# EAGLE design ce_hdd_acsi (EAGLE 6.2)
Assembly variants: ACSI, SCSI

## Sheet 1 of 3: IKBD part
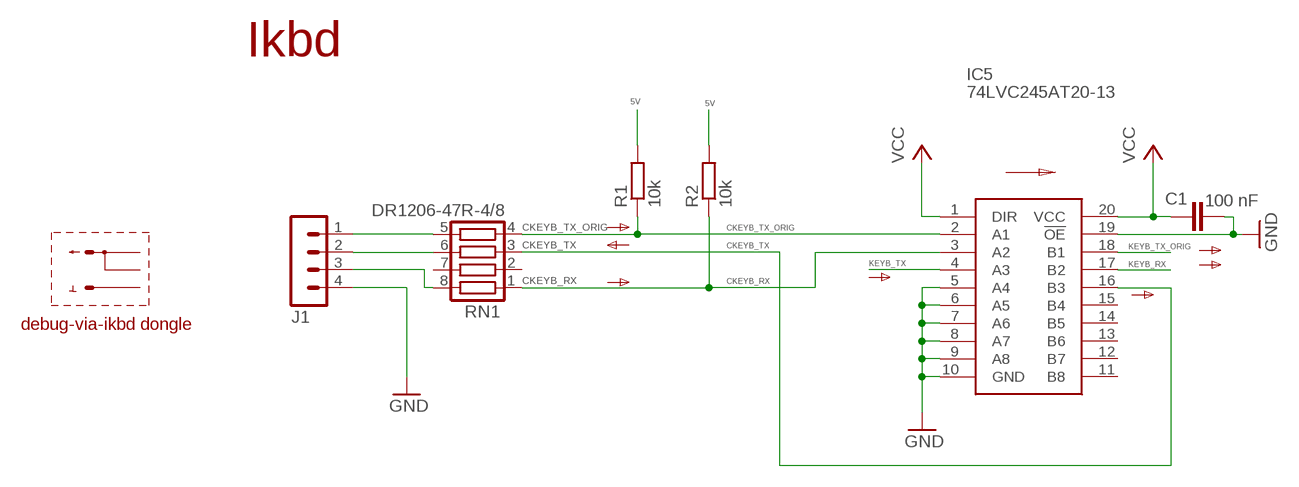
[diagram p0: schematic, sheet 1]

### Parts
C1  100 nF  C-EUC0603  [C0603]
IC5  74LVC245AT20-13  [SOP65P640X120-20N]
J1  MA04-1  [MA04-1]
R1  10k  R-EU_R0603  [R0603]
R2  10k  R-EU_R0603  [R0603]
RN1  DR1206-47R-4/8  CTS742C083  [CTS742C083]

### Nets
5V: R1.2 R2.2 ; also sheet 3
CKEYB_RX: IC5.3(A2) R2.1 RN1.1
CKEYB_TX: IC5.16(B3) RN1.3
CKEYB_TX_ORIG: IC5.2(A1) R1.1 RN1.4
GND: C1.1 IC5.5(A4) IC5.6(A5) IC5.7(A6) IC5.8(A7) IC5.9(A8) IC5.10(GND) IC5.19(!OE) J1.4 ; also sheet 2,3
KEYB_RX: IC5.17(B2) ; also sheet 3
KEYB_TX: IC5.4(A3) ; also sheet 3
KEYB_TX_ORIG: IC5.18(B1) ; also sheet 3
N$21: J1.2 RN1.6
VCC: C1.2 IC5.1(DIR) IC5.20(VCC) ; also sheet 2,3
ZKEYB_RX: J1.3 RN1.8
ZKEYB_TX_ORIG: J1.1 RN1.5
Unconnected: IC5.11(B8) IC5.12(B7) IC5.13(B6) IC5.14(B5) IC5.15(B4) RN1.2 RN1.7

### Notes on the sheet
- Ikbd
- debug-via-ikbd dongle

## Sheet 2 of 3: ACSI driver and connector
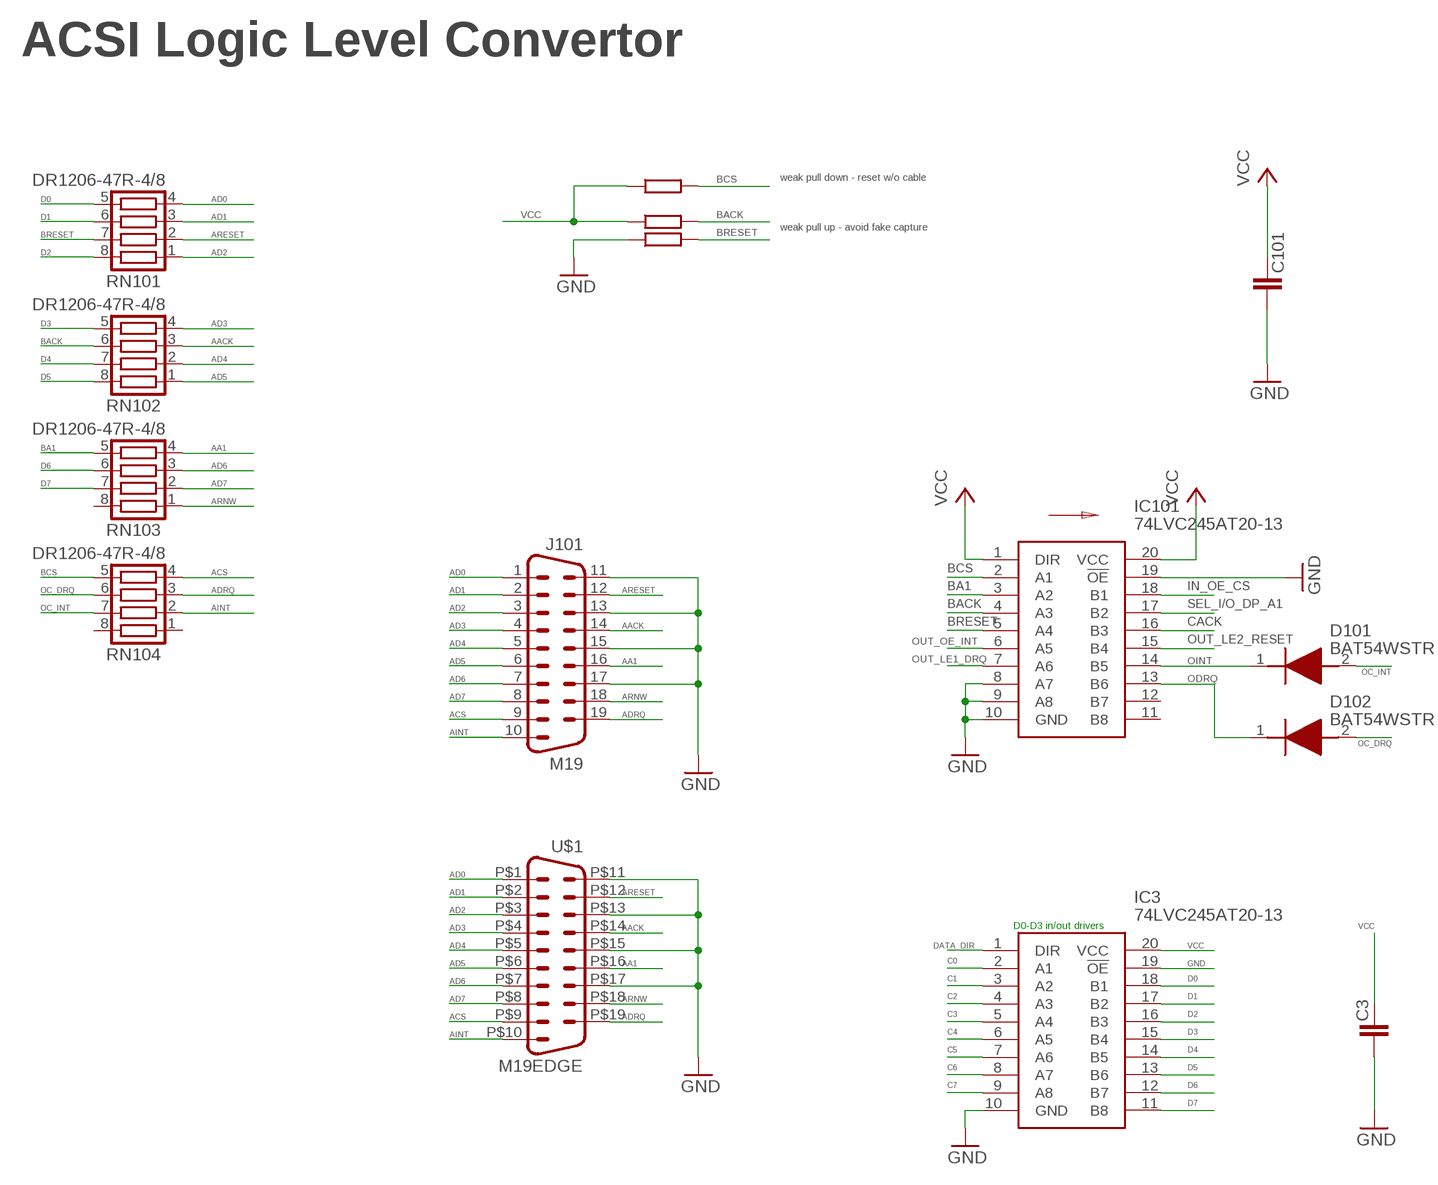
[diagram p1: schematic, sheet 2]

### Parts
C3  100 nF  C-EUC0603  [C0603]
C101  1 uF  C-EUC0603  [C0603]  (not fitted in variant SCSI)
D101  BAT54WSTR  [SOD2613X100N]  (not fitted in variant SCSI)
D102  BAT54WSTR  [SOD2613X100N]  (not fitted in variant SCSI)
IC3  74LVC245AT20-13  [SOP65P640X120-20N]
IC101  74LVC245AT20-13  [SOP65P640X120-20N]  (not fitted in variant SCSI)
J101  M19  [M19]  (not fitted in variant SCSI)
R102  10k  R-EU_R0603  [R0603]  (not fitted in variant SCSI)
R103  10k  R-EU_R0603  [R0603]  (not fitted in variant SCSI)
R104  10k  R-EU_R0603  [R0603]  (not fitted in variant SCSI)
RN101  DR1206-47R-4/8  CTS742C083  [CTS742C083]  (not fitted in variant SCSI)
RN102  DR1206-47R-4/8  CTS742C083  [CTS742C083]  (not fitted in variant SCSI)
RN103  DR1206-47R-4/8  CTS742C083  [CTS742C083]  (not fitted in variant SCSI)
RN104  DR1206-47R-4/8  CTS742C083  [CTS742C083]  (not fitted in variant SCSI)
U$1  M19EDGE  [M19_EDGE]

### Nets
AA1: J101.16 RN103.4 U$1.P$16
AACK: J101.14 RN102.3 U$1.P$14
ACS: J101.9 RN104.4 U$1.P$9
AD0: J101.1 RN101.4 U$1.P$1
AD1: J101.2 RN101.3 U$1.P$2
AD2: J101.3 RN101.1 U$1.P$3
AD3: J101.4 RN102.4 U$1.P$4
AD4: J101.5 RN102.2 U$1.P$5
AD5: J101.6 RN102.1 U$1.P$6
AD6: J101.7 RN103.3 U$1.P$7
AD7: J101.8 RN103.2 U$1.P$8
ADRQ: J101.19 RN104.3 U$1.P$19
AINT: J101.10 RN104.2 U$1.P$10
ARESET: J101.12 RN101.2 U$1.P$12
ARNW: J101.18 RN103.1 U$1.P$18
BA1: IC101.3(A2) RN103.5
BACK: IC101.4(A3) R103.2 RN102.6
BCS: IC101.2(A1) R102.2 RN104.5
BRESET: IC101.5(A4) R104.2 RN101.7
C0: IC3.2(A1) ; also sheet 3
C1: IC3.3(A2) ; also sheet 3
C2: IC3.4(A3) ; also sheet 3
C3: IC3.5(A4) ; also sheet 3
C4: IC3.6(A5) ; also sheet 3
C5: IC3.7(A6) ; also sheet 3
C6: IC3.8(A7) ; also sheet 3
C7: IC3.9(A8) ; also sheet 3
CACK: IC101.16(B3) ; also sheet 3
D0: IC3.18(B1) RN101.5
D1: IC3.17(B2) RN101.6
D2: IC3.16(B3) RN101.8
D3: IC3.15(B4) RN102.5
D4: IC3.14(B5) RN102.7
D5: IC3.13(B6) RN102.8
D6: IC3.12(B7) RN103.6
D7: IC3.11(B8) RN103.7
DATA_DIR: IC3.1(DIR) ; also sheet 3
GND: C3.2 C101.2 IC3.10(GND) IC3.19(!OE) IC101.8(A7) IC101.9(A8) IC101.10(GND) IC101.19(!OE) J101.11 J101.13 J101.15 J101.17 R104.1 U$1.P$11 U$1.P$13 U$1.P$15 U$1.P$17 ; also sheet 1,3
IN_OE_CS: IC101.18(B1) ; also sheet 3
OC_DRQ: D102.2(A) RN104.6
OC_INT: D101.2(A) RN104.7
ODRQ: D102.1(K) IC101.13(B6)
OINT: D101.1(K) IC101.14(B5)
OUT_LE1_DRQ: IC101.7(A6) ; also sheet 3
OUT_LE2_RESET: IC101.15(B4) ; also sheet 3
OUT_OE_INT: IC101.6(A5) ; also sheet 3
SEL_I/O_DP_A1: IC101.17(B2) ; also sheet 3
VCC: C3.1 C101.1 IC3.20(VCC) IC101.1(DIR) IC101.20(VCC) R102.1 R103.1 ; also sheet 1,3
Unconnected: IC101.11(B8) IC101.12(B7) RN103.8 RN104.1 RN104.8

### Notes on the sheet
- ACSI Logic Level Convertor
- weak pull down - reset w/o cable
- weak pull up - avoid fake capture
- D0-D3 in/out drivers

## Sheet 3 of 3: PICO, power, LEDs
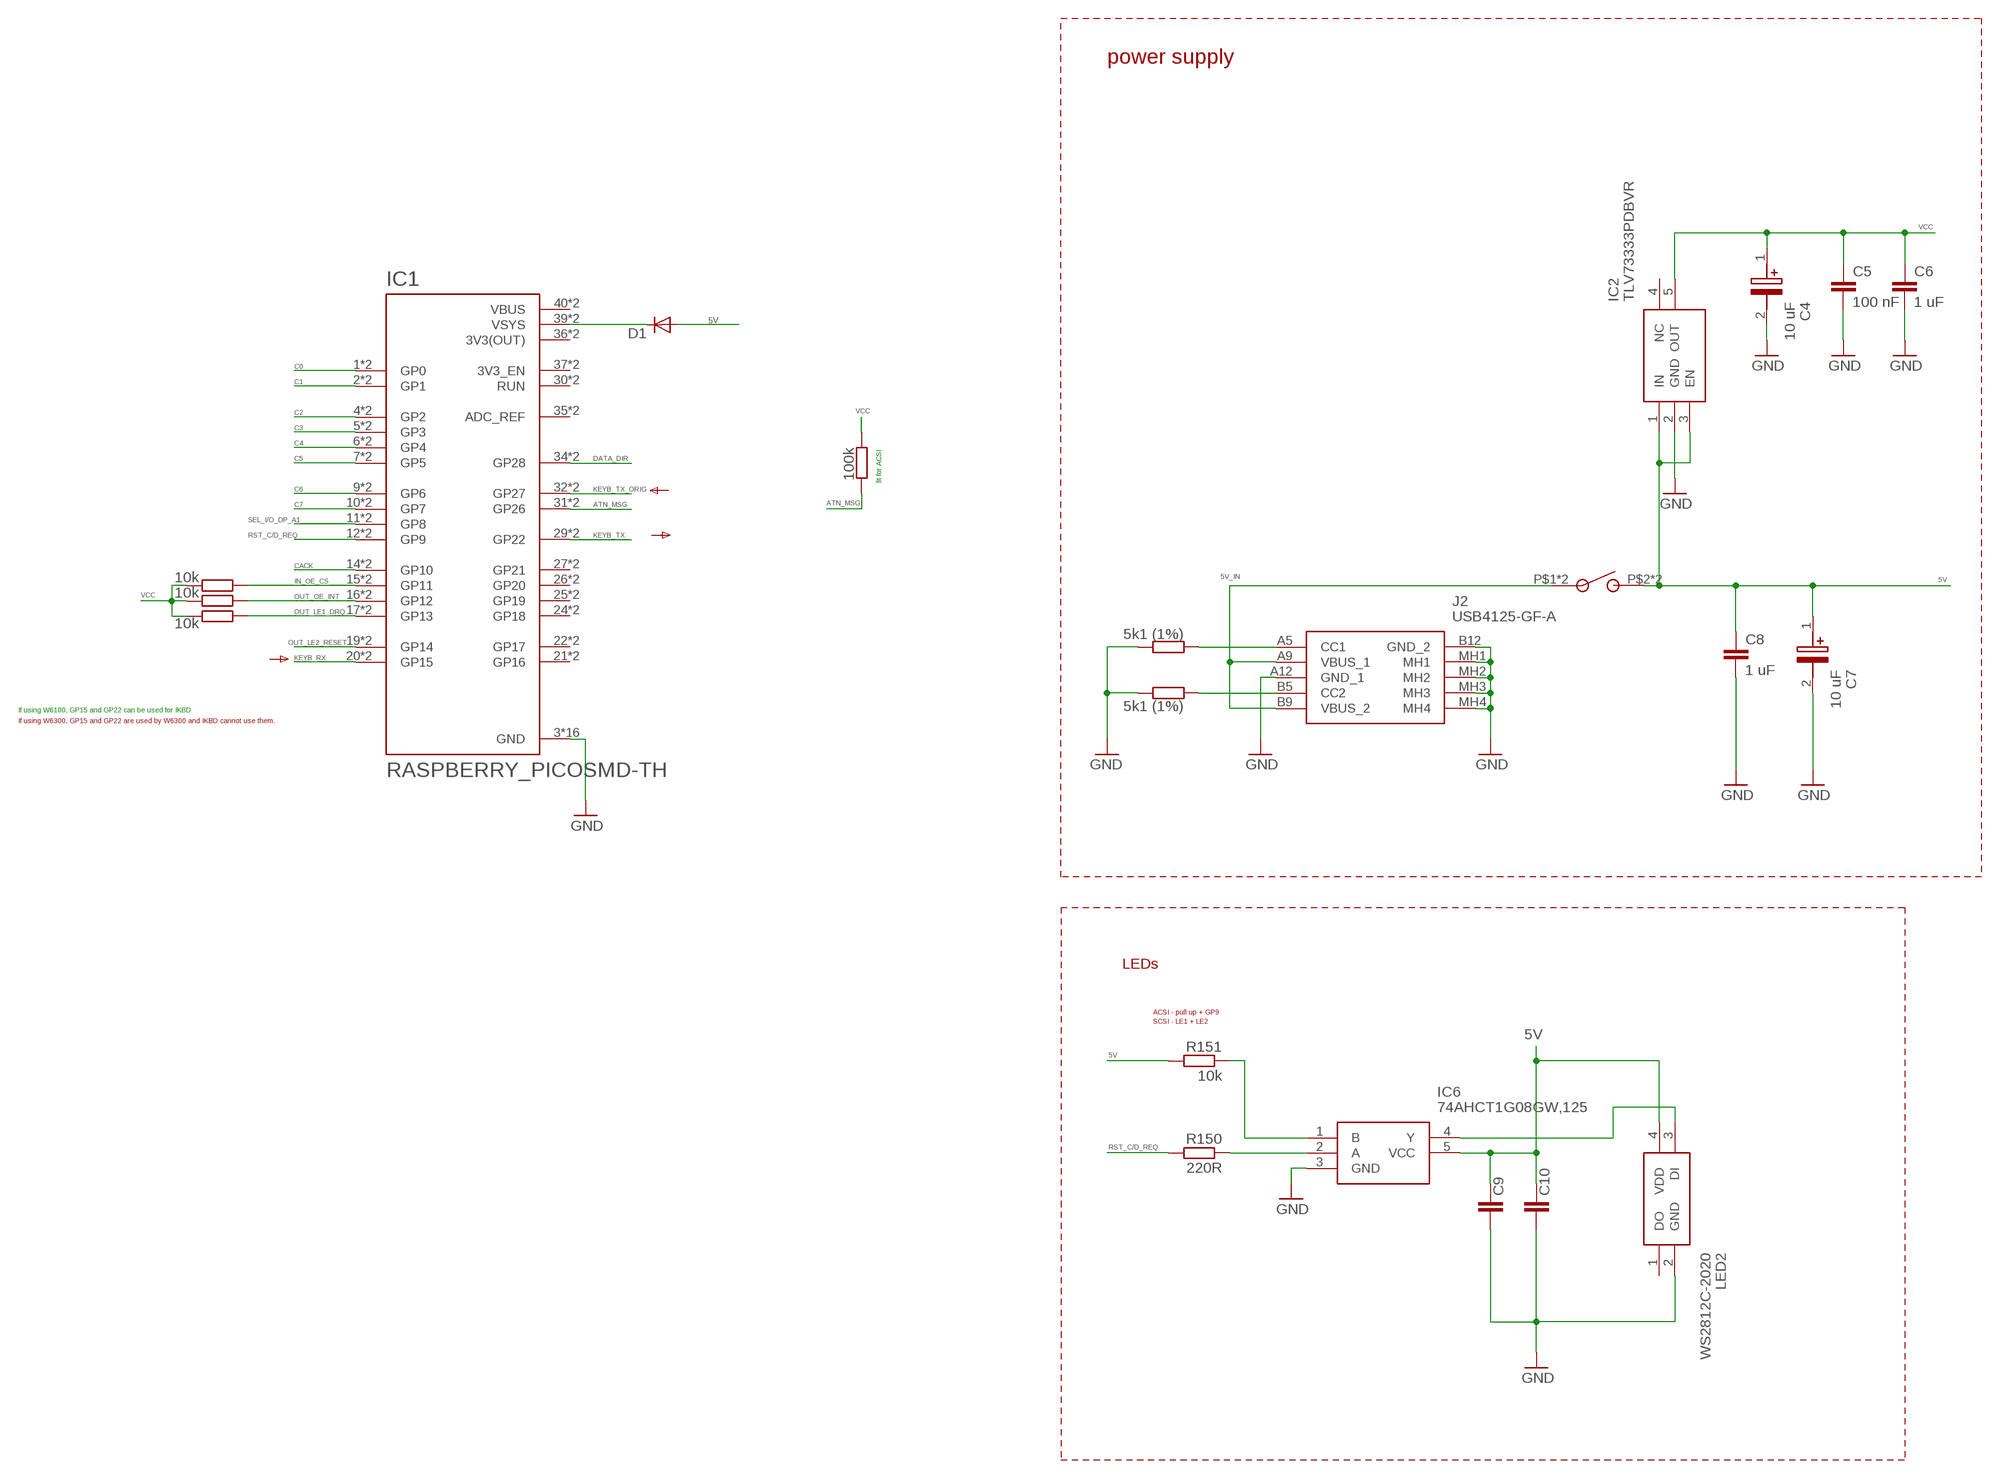
[diagram p2: schematic, sheet 3]

### Parts
C4  10 uF  293D106X9016B2TE3  [CAPPM3528X210N]
C5  100 nF  C-EUC0603  [C0603]
C6  1 uF  C-EUC0603  [C0603]
C7  10 uF  293D106X9016B2TE3  [CAPPM3528X210N]
C8  1 uF  C-EUC0603  [C0603]
C9  100 nF  C-EUC0603  [C0603]
C10  100 nF  C-EUC0603  [C0603]
D1  SK110-DIO  DIODE-DO214AC  [DO214AC]
IC1  RASPBERRY_PICOSMD-TH  [PICO-PKG]
IC2  TLV73333PDBVR  [SOT95P280X145-5N]
IC6  74AHCT1G08GW,125  [SOT65P212X110-5N]
J2  USB4125-GF-A  [USB4125GFA]
LED2  WS2812C-2020  [WS2812C2020]
R3  5k1 (1%)  R-EU_R0603  [R0603]
R4  5k1 (1%)  R-EU_R0603  [R0603]
R6  10k  R-EU_R0603  [R0603]
R7  10k  R-EU_R0603  [R0603]
R8  10k  R-EU_R0603  [R0603]
R125  100k  R-EU_R0603  [R0603]  (not fitted in variant SCSI)
R150  220R  R-EU_R0603  [R0603]  (not fitted in variant SCSI)
R151  10k  R-EU_R0603  [R0603]  (not fitted in variant SCSI)
SW1  SMSR-1  [SMRS-1]

### Nets
5V: C7.1(+) C8.1 C9.1 C10.1 D1.A IC2.1(IN) IC2.3(EN) IC6.5(VCC) LED2.4(VDD) R151.2 SW1.P$2 SW1.P$3 ; also sheet 1
5V_IN: J2.A9(VBUS_1) J2.B9(VBUS_2) SW1.P$1 SW1.P$4
ATN_MSG: IC1.31(GP26) IC1.P$31(GP26) R125.2
C0: IC1.1(GP0) IC1.P$1(GP0) ; also sheet 2
C1: IC1.2(GP1) IC1.P$2(GP1) ; also sheet 2
C2: IC1.4(GP2) IC1.P$4(GP2) ; also sheet 2
C3: IC1.5(GP3) IC1.P$5(GP3) ; also sheet 2
C4: IC1.6(GP4) IC1.P$6(GP4) ; also sheet 2
C5: IC1.7(GP5) IC1.P$7(GP5) ; also sheet 2
C6: IC1.9(GP6) IC1.P$9(GP6) ; also sheet 2
C7: IC1.10(GP7) IC1.P$10(GP7) ; also sheet 2
CACK: IC1.14(GP10) IC1.P$14(GP10) ; also sheet 2
DATA_DIR: IC1.34(GP28) IC1.P$34(GP28) ; also sheet 2
GND: C4.2(-) C5.2 C6.2 C7.2(-) C8.2 C9.2 C10.2 IC1.3(GND) IC1.8(GND) IC1.13(GND) IC1.18(GND) IC1.23(GND) IC1.28(GND) IC1.33(GND) IC1.38(GND) IC1.P$3(GND) IC1.P$8(GND) IC1.P$13(GND) IC1.P$18(GND) IC1.P$23(GND) IC1.P$28(GND) IC1.P$33(GND) IC1.P$38(GND) IC2.2(GND) IC6.3(GND) J2.A12(GND_1) J2.B12(GND_2) J2.MH1 J2.MH2 J2.MH3 J2.MH4 LED2.2(GND) R3.2 R4.2 ; also sheet 1,2
IN_OE_CS: IC1.15(GP11) IC1.P$15(GP11) R6.2 ; also sheet 2
KEYB_RX: IC1.20(GP15) IC1.P$20(GP15) ; also sheet 1
KEYB_TX: IC1.29(GP22) IC1.P$29(GP22) ; also sheet 1
KEYB_TX_ORIG: IC1.32(GP27) IC1.P$32(GP27) ; also sheet 1
N$1: J2.B5(CC2) R4.1
N$2: J2.A5(CC1) R3.1
N$3: IC6.2(A) R150.1
N$4: IC6.1(B) R151.1
N$7: IC6.4(Y) LED2.3(DI)
N$26: D1.C IC1.39(VSYS) IC1.P$39(VSYS)
OUT_LE1_DRQ: IC1.17(GP13) IC1.P$17(GP13) R8.2 ; also sheet 2
OUT_LE2_RESET: IC1.19(GP14) IC1.P$19(GP14) ; also sheet 2
OUT_OE_INT: IC1.16(GP12) IC1.P$16(GP12) R7.2 ; also sheet 2
RST_C/D_REQ: IC1.12(GP9) IC1.P$12(GP9) R150.2
SEL_I/O_DP_A1: IC1.11(GP8) IC1.P$11(GP8) ; also sheet 2
VCC: C4.1(+) C5.1 C6.1 IC2.5(OUT) R6.1 R7.1 R8.1 R125.1 ; also sheet 1,2
Unconnected: IC1.21(GP16) IC1.22(GP17) IC1.24(GP18) IC1.25(GP19) IC1.26(GP20) IC1.27(GP21) IC1.30(RUN) IC1.35(ADC_REF) IC1.37(3V3_EN) IC1.P$21(GP16) IC1.P$22(GP17) IC1.P$24(GP18) IC1.P$25(GP19) IC1.P$26(GP20) IC1.P$27(GP21) IC1.P$30(RUN) IC1.P$35(ADC_REF) IC1.P$37(3V3_EN) IC2.4(NC) LED2.1(DO)

### Notes on the sheet
- power supply
- fit for ACSI
- If using W6100, GP15 and GP22 can be used for IKBD
- If using W6300, GP15 and GP22 are used by W6300 and IKBD cannot use them.
- LEDs
- ACSI - pull up + GP9
- SCSI - LE1 + LE2

## Power pins joined to a net without a drawn wire
3V3(OUT): IC1.36(3V3(OUT)) IC1.P$36(3V3(OUT))
VBUS: IC1.40(VBUS) IC1.P$40(VBUS)

## Library data of the parts
C1 C3 C5 C6 C8-C10 C101 = rcl:C-EU: CAPACITOR, European symbol
C4 C7 = 293D106X9016B2TE3:293D106X9016B2TE3: Solid Tantalum Surface Mount Chip Capacitors TANTAMOUNT(TM), Molded Case, Standard Industrial Grade Source: Datasheet <http://www.vishay.com/docs/40002/293d.pdf>; DESCRIPTION: Solid Tantalum Surface Mount Chip Capacitors TANTAMOUNT(TM), Molded Case, Standard Industrial Grade; HEIGHT: 2.1mm; MANUFACTURER_NAME: Vishay; MANUFACTURER_PART_NUMBER: 293D106X9016B2TE3
D1 = diode:DIODE-: DIODE
D101 D102 = BAT54WSTR:BAT54WSTR: DIODE SCHOTTKY 30V 200MA SOD323 Source: Datasheet <http://www.smc-diodes.com/propdf/BAT54WS N0714 REV.D.pdf>; DESCRIPTION: DIODE SCHOTTKY 30V 200MA SOD323; HEIGHT: 1mm; MANUFACTURER_NAME: SMC Diode Solutions; MANUFACTURER_PART_NUMBER: BAT54WSTR
IC1 = RpiPico:RASPBERRY_PICO: Raspberry Pi Pico
IC2 = TLV73333PDBVR:TLV73333PDBVR: Capacitor-free 300-mA low-dropout (LDO) regulator with foldback current limit for portable devices Source: Datasheet <http://www.ti.com/lit/gpn/tlv733p>; DESCRIPTION: Capacitor-free 300-mA low-dropout (LDO) regulator with foldback current limit for portable devices; HEIGHT: 1.45mm; MANUFACTURER_NAME: Texas Instruments; MANUFACTURER_PART_NUMBER: TLV73333PDBVR
IC3 IC5 IC101 = 74LVC245AT20-13:74LVC245AT20-13: Bus Transceivers Octal Buffer Trans 3-State Outputs Source: Datasheet <https://www.diodes.com/assets/Datasheets/74LVC245A.pdf>; DESCRIPTION: Bus Transceivers Octal Buffer Trans 3-State Outputs; HEIGHT: 1.2mm; MANUFACTURER_NAME: Diodes Incorporated; MANUFACTURER_PART_NUMBER: 74LVC245AT20-13
IC6 = 74AHCT1G08GW_125:74AHCT1G08GW,125: 74AHC(T)1G08 - 2-input AND gate@en-us Source: Datasheet <https://assets.nexperia.com/documents/data-sheet/74AHC_AHCT1G08.pdf>; DESCRIPTION: 74AHC(T)1G08 - 2-input AND gate@en-us; HEIGHT: 1.1mm; MANUFACTURER_NAME: Nexperia; MANUFACTURER_PART_NUMBER: 74AHCT1G08GW,125
J1 = con-lstb:MA04-1: PIN HEADER; OC_FARNELL: unknown; OC_NEWARK: unknown
J2 = USB4125-GF-A:USB4125-GF-A: USB-C (USB TYPE-C) Receptacle Connector 24 (6+18 Dummy) Position Surface Mount, Right Angle; Through Hole Source: Datasheet <https://gct.co/files/drawings/usb4125.pdf?v=f2858e04-a173-4b74-b17f-8f865ddc3728>; DESCRIPTION: USB-C (USB TYPE-C) Receptacle Connector 24 (6+18 Dummy) Position Surface Mount, Right Angle; Through Hole; HEIGHT: 3.41mm; MANUFACTURER_NAME: GCT (GLOBAL CONNECTOR TECHNOLOGY); MANUFACTURER_PART_NUMBER: USB4125-GF-A
J101 U$1 = con_subd19:M19
LED2 = WS2812C-2020:WS2812C-2020: Intelligent control LED integrated light source Source: Datasheet <http://www.world-semi.com/DownLoadFile/139>; DESCRIPTION: Intelligent control LED integrated light source; HEIGHT: 0.84mm; MANUFACTURER_NAME: Worldsemi; MANUFACTURER_PART_NUMBER: WS2812C-2020
R1-R4 R6-R8 R102-R104 R125 R150 R151 = rcl:R-EU_: RESISTOR, European symbol
RN1 RN101-RN104 = resistor-net:CTS742C083: Chip Resistor Array 4 Single Resistor Source: http://www.ctscorp.com/components/Datasheets/CTSChipArrayDs.pdf; OC_FARNELL: unknown; OC_NEWARK: unknown
SW1 = ce_fdd_v40:SMSR-1

## Board
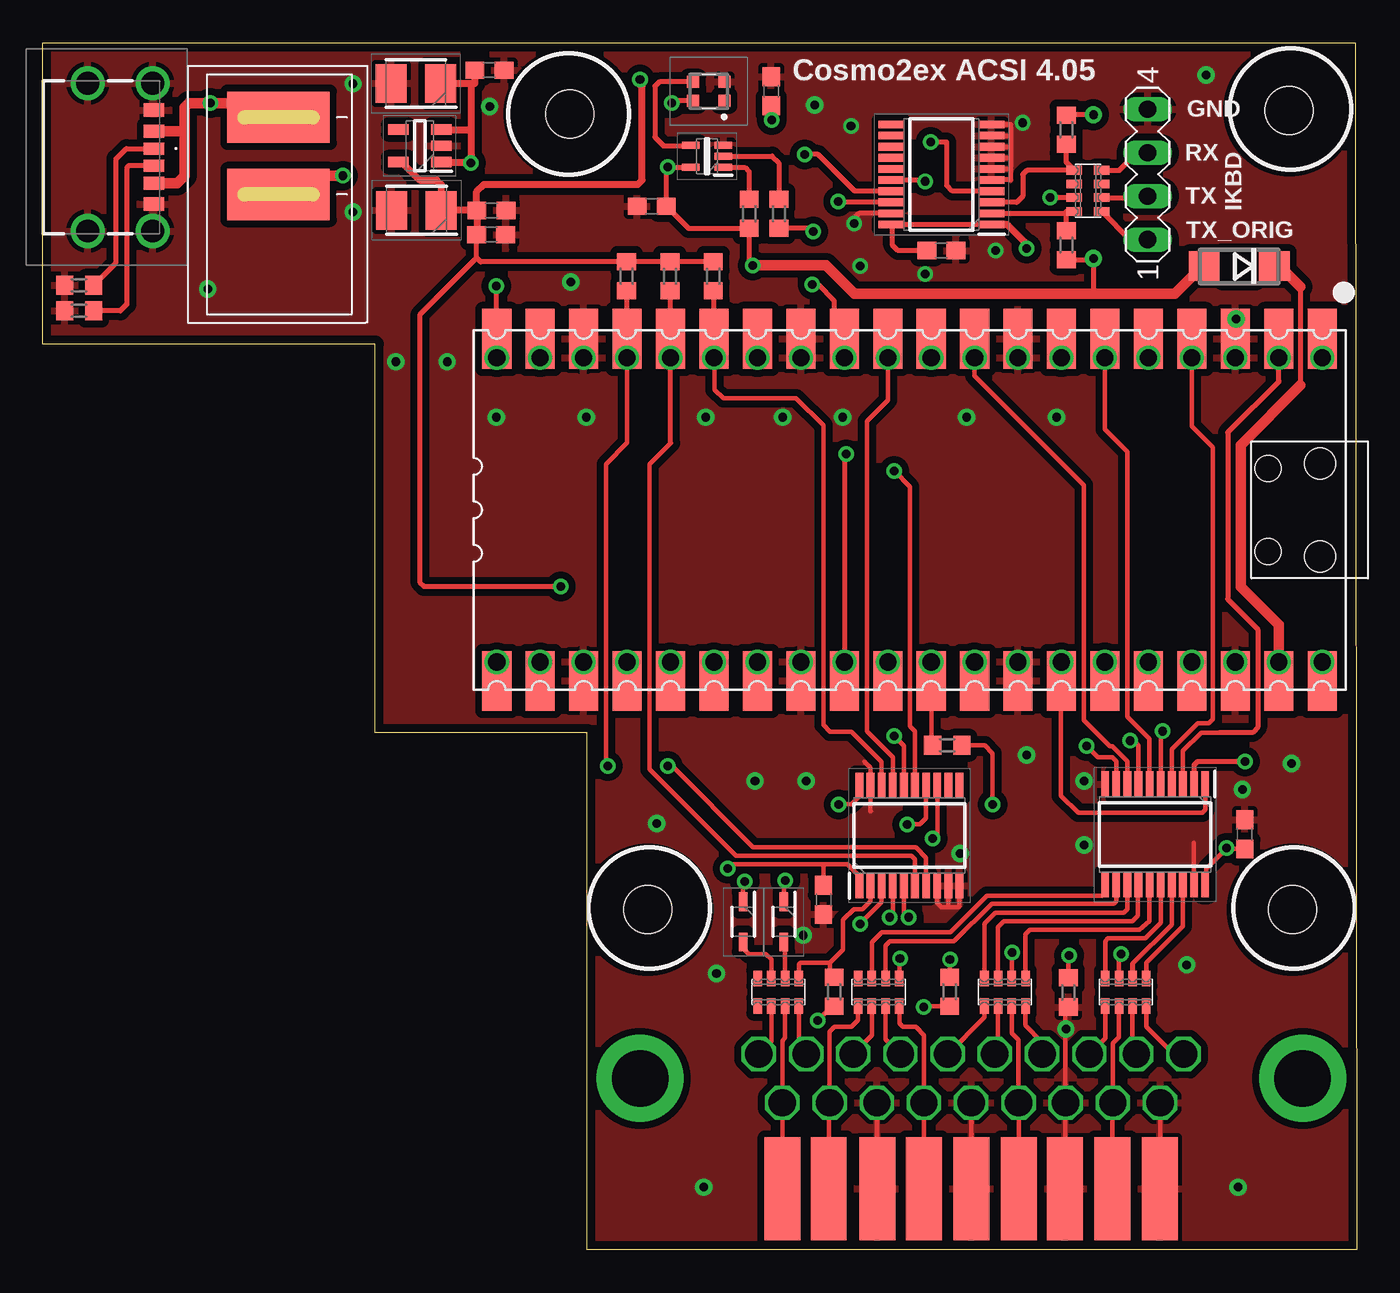
[diagram p3: board, top side]
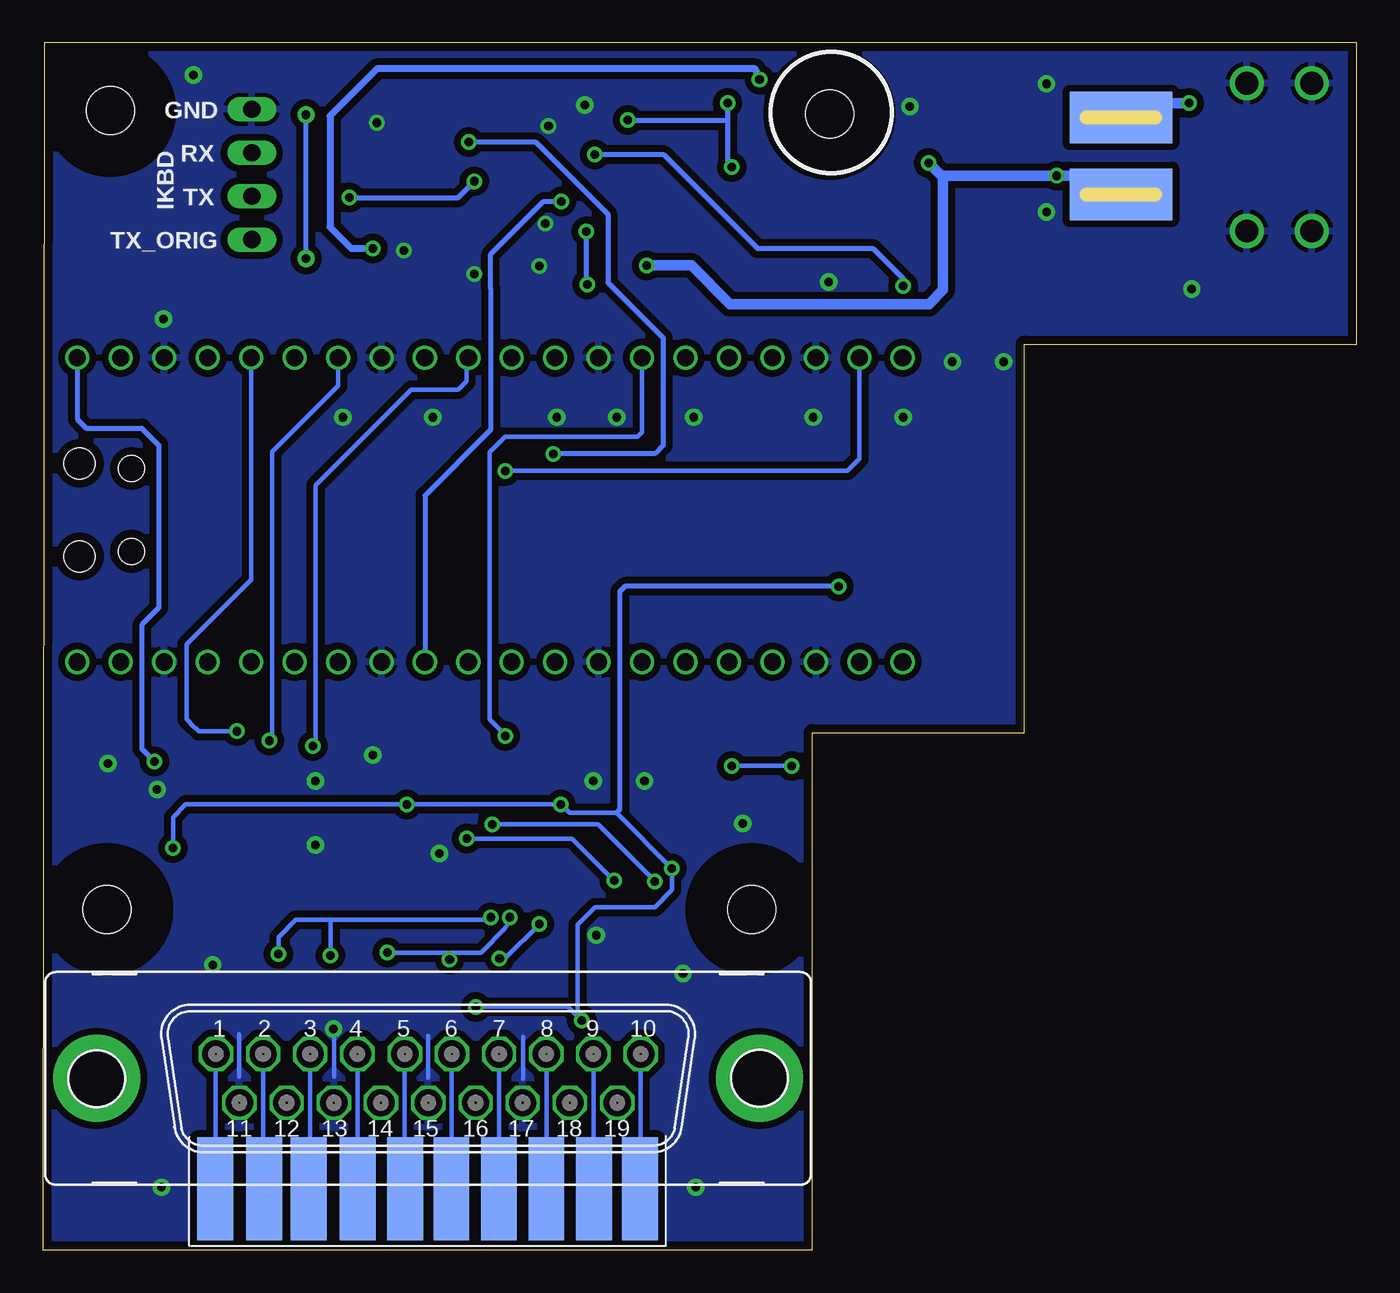
[diagram p4: board, bottom side, seen from below]

Size 76.84 x 70.56 mm. Coordinates in mm from the lower left corner, seen from the top.
Outline: 0,70.56 76.76,70.56 76.83,0 31.83,0 31.83,30.24 19.45,30.24 19.45,52.94 0,52.94 0,70.56
Copper layers (1*16): Top 0.035mm / dielectric 1.5mm / Bottom 0.035mm
Design rules: minimum track width 0.2mm, minimum drill 0.4mm, track to track 0.2mm, track to pad 0.2mm, pad to pad 0.2mm, via to via 0.2mm, smd to smd 0mil, copper to edge 0.5mm, drill to drill 0.5mm, minimum pad ring 8mil, minimum via ring 8mil, stop-mask expansion 4mil, vias tented up to drill 0mil, thermal gap 10mil
Holes 2.8 mm at 72.89,66.61 35.38,19.9 73.08,19.9 30.82,66.41
tKeepout: area 69.5,63.2 to 76.3,70; area 31.9,16.5 to 38.8,23.3; area 69.6,16.5 to 76.5,23.3; area 27.4,63 to 34.3,69.9
bKeepout: area 69.4,63.1 to 76.3,70.1; area 31.9,16.4 to 38.8,23.4; area 69.6,16.4 to 76.5,23.4; area 27.4,63 to 34.3,69.8
tRestrict: area 69.4,63.2 to 76.3,70.1; area 68.9,56.5 to 71,58.4; area 31.9,16.4 to 38.8,23.3; area 69.6,16.4 to 76.5,23.3; area 27.4,62.9 to 34.3,69.9
bRestrict: area 69.4,63.1 to 76.3,70.1; area 31.9,16.4 to 38.8,23.4; area 69.6,16.4 to 76.5,23.4; area 27.4,63 to 34.3,69.9

### Footprints (pad centres in the part's own frame; a part is rotated, then mirrored left to right if it is on the bottom)
C0603 = smd 1.1 x 1: 1 -0.85,0; 2 0.85,0
CAPPM3528X210N = smd 1.8 x 2.25: 1 -1.45,0; 2 1.45,0
DO214AC = smd 1.8 x 1.7: A 2.05,0; C -2.05,0
SOD2613X100N = smd 1.1 x 0.5: 1 -1.175,0; 2 1.175,0
PICO-PKG = drill 1: 1 -8.89,24.13; 2 -8.89,21.59; 3 -8.89,19.05; 4 -8.89,16.51; 5 -8.89,13.97; 6 -8.89,11.43; 7 -8.89,8.89; 8 -8.89,6.35; 9 -8.89,3.81; 10 -8.89,1.27; 11 -8.89,-1.27; 12 -8.89,-3.81; 13 -8.89,-6.35; 14 -8.89,-8.89; 15 -8.89,-11.43; 16 -8.89,-13.97; 17 -8.89,-16.51; 18 -8.89,-19.05; 19 -8.89,-21.59; 20 -8.89,-24.13; 21 8.89,-24.13; 22 8.89,-21.59; 23 8.89,-19.05; 24 8.89,-16.51; 25 8.89,-13.97; 26 8.89,-11.43; 27 8.89,-8.89; 28 8.89,-6.35; 29 8.89,-3.81; 30 8.89,-1.27; 31 8.89,1.27; 32 8.89,3.81; 33 8.89,6.35; 34 8.89,8.89; 35 8.89,11.43; 36 8.89,13.97; 37 8.89,16.51; 38 8.89,19.05; 39 8.89,21.59; 40 8.89,24.13 | smd 3.5 x 1.7: P$1 -10,24.13; P$2 -10,21.59; P$3 -10,19.05; P$4 -10,16.51; P$5 -10,13.97; P$6 -10,11.43; P$7 -10,8.89; P$8 -10,6.35; P$9 -10,3.81; P$10 -10,1.27; P$11 -10,-1.27; P$12 -10,-3.81; P$13 -10,-6.35; P$14 -10,-8.89; P$15 -10,-11.43; P$16 -10,-13.97; P$17 -10,-16.51; P$18 -10,-19.05; P$19 -10,-21.59; P$20 -10,-24.13; P$21 10,-24.13; P$22 10,-21.59; P$23 10,-19.05; P$24 10,-16.51; P$25 10,-13.97; P$26 10,-11.43; P$27 10,-8.89; P$28 10,-6.35; P$29 10,-3.81; P$30 10,-1.27; P$31 10,1.27; P$32 10,3.81; P$33 10,6.35; P$34 10,8.89; P$35 10,11.43; P$36 10,13.97; P$37 10,16.51; P$38 10,19.05; P$39 10,21.59; P$40 10,24.13 | hole 1.8: -2.725,24; 2.725,24 | hole 1.5: -2.425,20.97; 2.425,20.97
SOT95P280X145-5N = smd 1.2 x 0.6: 1 -1.25,0.95; 2 -1.25,0; 3 -1.25,-0.95; 4 1.25,-0.95; 5 1.25,0.95
SOP65P640X120-20N = smd 1.475 x 0.45: 1 -2.938,2.925; 2 -2.938,2.275; 3 -2.938,1.625; 4 -2.938,0.975; 5 -2.938,0.325; 6 -2.938,-0.325; 7 -2.938,-0.975; 8 -2.938,-1.625; 9 -2.938,-2.275; 10 -2.938,-2.925; 11 2.938,-2.925; 12 2.938,-2.275; 13 2.938,-1.625; 14 2.938,-0.975; 15 2.938,-0.325; 16 2.938,0.325; 17 2.938,0.975; 18 2.938,1.625; 19 2.938,2.275; 20 2.938,2.925
SOT65P212X110-5N = smd 1.05 x 0.4: 1 -0.95,0.65; 2 -0.95,0; 3 -0.95,-0.65; 4 0.95,-0.65; 5 0.95,0.65
MA04-1 = drill 1.016 long: 1 -3.81,0; 2 -1.27,0; 3 1.27,0; 4 3.81,0
USB4125GFA = smd 0.7 x 1.2: A5 -0.5,2.778; B5 0.5,2.778 | smd 0.76 x 1.2: A9 1.52,2.778; B9 -1.52,2.778 | smd 0.8 x 1.2: A12 2.75,2.778; B12 -2.75,2.778 | drill 1.34 pad 2.01: MH1 4.32,2.698; MH2 4.32,-1.102; MH3 -4.32,-1.102; MH4 -4.32,2.698
M19 = drill 1.6 pad 2 octagon: 1 -12.751,1.422; 2 -9.982,1.422; 3 -7.239,1.422; 4 -4.47,1.422; 5 -1.702,1.422; 6 1.041,1.422; 7 3.81,1.422; 8 6.579,1.422; 9 9.322,1.422; 10 12.09,1.422; 11 -11.379,-1.422; 12 -8.611,-1.422; 13 -5.842,-1.422; 14 -3.099,-1.422; 15 -0.33,-1.422; 16 2.438,-1.422; 17 5.182,-1.422; 18 7.95,-1.422; 19 10.719,-1.422 | drill 3.302 pad 5.08: G1 -19.71,0; G2 19.03,0
WS2812C2020 = smd 0.7 x 0.7: 1 0.915,-0.55; 2 0.915,0.55; 3 -0.915,0.55; 4 -0.915,-0.55
R0603 = smd 1 x 1.1: 1 -0.85,0; 2 0.85,0
CTS742C083 = smd 0.5 x 0.9: 1 -1.2,-0.8; 2 -0.4,-0.8; 3 0.4,-0.8; 4 1.2,-0.8; 5 1.2,0.8; 6 0.4,0.8; 7 -0.4,0.8; 8 -1.2,0.8
SMRS-1 = smd 3 x 6 bottom: P$1 11.5,4.7; P$2 7,4.7 | smd 3 x 6: P$3 6.995,4.7; P$4 11.512,4.7
M19_EDGE = smd 2.1 x 6: P$1 -12.462,-0.476; P$2 -9.604,-0.476; P$3 -6.985,-0.476; P$4 -4.128,-0.476; P$5 -1.349,-0.476; P$6 1.349,-0.476; P$7 4.128,-0.476; P$8 6.906,-0.476; P$9 9.684,-0.476; P$10 12.383,-0.476 | smd 2.1 x 6 bottom: P$11 -11.033,-0.476; P$12 -8.255,-0.476; P$13 -5.477,-0.476; P$14 -2.778,-0.476; P$15 0,-0.476; P$16 2.778,-0.476; P$17 5.477,-0.476; P$18 8.334,-0.476; P$19 11.033,-0.476

### Placement (x,y rotation side)
C1  52.55,58.42 180 top
C3  70.29,24.29 90 top
C4  21.85,60.77 180 top
C5  45.65,20.46 270 top
C6  26.22,59.35 0 top
C7  21.82,68.18 180 top
C8  26.12,68.97 0 top
C9  35.61,61.02 180 top
C10  42.6,67.73 90 top
C101  26.23,60.76 0 top
D1  69.96,57.52 180 top
D101  40.96,19.17 270 top
D102  43.34,19.17 270 top
IC1  50.68,43.26 270 top
IC2  22.04,64.54 180 top
IC3  65.04,24.29 270 top
IC5  52.55,62.87 180 top
IC6  38.84,63.93 180 top
IC101  50.68,24.23 90 top
J1  64.61,62.87 90 top
J2  3.73,63.88 270 top
J101  53.96,10.03 0 bottom
LED2  38.94,67.73 0 top
R1  59.85,58.74 270 top
R2  59.85,65.48 90 top
R3  2.12,56.39 180 top
R4  2.12,54.89 180 top
R6  39.21,56.91 270 top
R7  36.67,56.91 270 top
R8  34.13,56.91 270 top
R102  46.28,15.09 90 top
R103  53.03,15.09 90 top
R104  59.97,15.05 90 top
R125  52.89,29.5 180 top
R150  43.05,60.57 270 top
R151  41.31,60.57 270 top
RN1  61.12,61.91 270 top
RN101  63.33,15.07 0 top
RN102  56.26,15.07 0 top
RN103  48.88,15.07 0 top
RN104  43.01,15.07 0 top
SW1  18.49,54.7 90 top
U$1  54.29,4.05 0 bottom

### Tracks (layer width: path | path; a pad name or v marks a point on that pad's centre or on a via)
3V3(OUT)
  Top 0.254: IC1.P$36 IC1.36
5V  (via drill 0.5, 0.5 pad 1.02)
  Top 0.305: R1.2 61.38,57.89 v61.44,57.94 61.44,55.88 | v61.44,66.36 59.87,66.36 R2.2 | LED2.4 36.93,67.18 v36.79,67.04 | IC6.5 37.88,63.29 v36.54,63.29 36.46,63.21 C9.1 37.76,59.72 R151.2 41.31,57.76 v41.52,57.55 | C10.1 42.6,66.07 v42.62,66.04
  Top 0.406: IC2.1 23.29,63.54 v25.04,63.54 25.04,65.49 | C8.1 25.27,68.18 C7.1 25.04,68.18 25.04,65.49 | IC2.3 25.04,65.49
  Top 0.61: D1.A 67.88,57.55 67.87,57.55 66.2,55.88 61.44,55.88 47.47,55.88 45.8,57.55 v41.52,57.55 41.51,57.55 | SW1.P$3 14.88,62.79 v17.54,62.79
  Bottom 0.305: v61.44,57.94 v61.44,66.36 | v36.79,67.04 36.79,66.04 | 36.79,66.04 36.79,63.54 v36.54,63.29 | v42.62,66.04 36.8,66.04 36.79,66.04
  Bottom 0.406: SW1.P$2 16.54,61.7 16.54,62.79
  Bottom 0.61: v41.52,57.55 38.89,57.55 36.64,55.29 25.03,55.29 24.21,56.11 24.21,62.75 23.49,62.79 | 16.54,62.79 v17.54,62.79 23.49,62.79 | 23.49,62.79 24.29,62.79 v25.04,63.54
5V_IN  (via drill 0.5)
  Top 0.61: J2.B9 8.29,65.4 | J2.A9 7.86,62.36 8.29,62.79 8.29,65.4 | 8.29,65.4 8.29,66.79 8.54,67.04 v9.79,67.04 12.96,67.04 SW1.P$4
  Bottom 0.406: 13.79,67.04 SW1.P$1
  Bottom 0.61: v9.79,67.04 13.79,67.04
AA1
  Top 0.254: RN103.4 50.08,13.25 50.29,13.04 51.04,13.04 51.52,12.56 J101.16 U$1.P$16
AACK
  Top 0.254: RN102.3 56.66,12.67 57.06,12.28 J101.14 U$1.P$14
ACS
  Top 0.254: RN104.4 44.21,12.38 44.64,11.95 J101.9
  Bottom 0.254: U$1.P$9 44.64,3.61 J101.9
AD0
  Top 0.254: J101.1 66.14,11.45 64.54,13.04 64.54,14.25 RN101.4
  Bottom 0.254: U$1.P$1 66.71,3.62 J101.1
AD1
  Top 0.254: J101.2 63.73,11.66 RN101.3
  Bottom 0.254: U$1.P$2 63.94,3.62 J101.2
AD2
  Top 0.254: J101.3 62.13,12.38 RN101.1
  Bottom 0.254: U$1.P$3 61.2,3.66 J101.3
AD3
  Top 0.254: J101.4 58.43,12.15 57.46,13.12 RN102.4
  Bottom 0.254: U$1.P$4 J101.4
AD4
  Top 0.254: J101.5 55.86,11.65 RN102.2
  Bottom 0.254: U$1.P$5 55.66,3.6 J101.5
AD5
  Top 0.254: J101.6 55.06,13.59 RN102.1
  Bottom 0.254: U$1.P$6 52.92,3.6 J101.6
AD6
  Top 0.254: RN103.3 49.28,12.32 J101.7
  Bottom 0.254: U$1.P$7 50.15,3.59 J101.7
AD7
  Top 0.254: RN103.2 48.48,12.55 J101.8
  Bottom 0.254: U$1.P$8 J101.8
ADRQ
  Top 0.254: RN104.3 43.41,12.41 43.24,12.24 J101.19 43.26,8.59 U$1.P$19
AINT
  Top 0.254: RN104.2 42.61,12.19 J101.10
  Bottom 0.254: U$1.P$10 41.87,3.62 J101.10
ARESET
  Top 0.254: RN101.2 62.93,12.43 62.57,12.07 J101.12 62.55,8.58 U$1.P$12
ARNW
  Top 0.254: RN103.1 47.68,13.43 47.29,13.04 46.29,13.04 46.01,12.76 J101.18 45.96,8.55 U$1.P$18
ATN_MSG
  Top 0.254: IC1.31 IC1.P$31 51.95,29.58 R125.2
BA1  (via drill 0.5)
  Top 0.254: RN103.5 50.09,17 50.16,17 v50.12,17.04 | v47.79,19.04 47.79,19.06 49.05,20.32 IC101.3
  Bottom 0.254: v50.12,17.04 49.79,17.04 v47.79,19.04
BACK  (via drill 0.5)
  Top 0.254: RN102.6 56.66,17.37 v56.67,17.38 | v49.53,19.45 49.7,19.86 IC101.4 | R103.2 53.03,16.82 v53.05,16.99
  Bottom 0.254: v56.67,17.38 53.05,17.38 | 53.05,17.38 51.2,17.38 49.79,18.79 49.54,19.19 v49.53,19.45 | v53.05,16.99 53.05,17.38
BCS
  Top 0.254: IC101.2 48.4,20.38 47.94,19.92 47.42,19.92 46.79,19.29 46.79,17.54 46.04,16.79 | RN104.5 44.21,16.71 44.29,16.79 46.04,16.79 | 46.04,16.79 46.04,15.88 R102.2
BRESET  (via drill 0.5)
  Top 0.254: RN101.7 62.93,17.18 v63.04,17.29 | v50.64,19.45 50.35,19.66 IC101.5 | R104.2 59.97,17.18 v60.01,17.22
  Bottom 0.254: v63.04,17.29 63.04,18.29 62.04,19.29 60.01,19.29 | 60.01,19.29 50.49,19.29 v50.64,19.45 | v60.01,17.22 60.01,19.29
C0  (via drill 0.5)
  Top 0.254: IC1.1 IC1.P$1
  Top 0.305: v70.29,28.54 67.52,28.54 67.32,28.34 IC3.2
  Bottom 0.305: IC1.1 74.81,48.56 74.29,48.04 71.04,48.04 70.04,47.04 70.04,37.54 71.04,36.54 71.04,29.29 v70.29,28.54
C1
  Top 0.254: IC1.2 IC1.P$2 | 68.82,30.24 67.74,30.24 66.67,29.17 IC3.3
  Top 0.305: 68.82,30.24 70.74,30.24 71.04,30.54 71.04,36.29 69.29,38.04 69.29,47.79 72.29,50.79 72.27,50.82 IC1.2
C2
  Top 0.254: IC1.P$4 IC1.4 67.19,48.15 68.42,46.92 68.42,31.04 68.18,30.79 67.54,30.79 66.02,29.27 IC3.4
C3  (via drill 0.5)
  Top 0.254: IC1.5 IC1.P$5 | v65.48,30.32 65.37,30.21 IC3.5
  Bottom 0.254: IC1.5 64.65,39.18 68.42,35.41 68.42,31.04 68.18,30.8 68.21,30.8 67.73,30.32 v65.48,30.32
C4
  Top 0.254: IC1.P$6 IC1.6 62.11,47.98 63.42,46.67 63.42,31.17 64.72,29.87 IC3.6
C5  (via drill 0.5)
  Top 0.254: IC1.7 IC1.P$7 | IC3.7 64.07,29.51 63.82,29.77 v63.58,29.77
  Bottom 0.254: v63.58,29.77 63.42,29.92 63.42,46.67 59.57,50.52 IC1.7
C6
  Top 0.254: IC1.P$9 IC1.9 54.49,51.1 60.88,44.71 60.88,30.96 62.39,29.45 62.55,29.45 63.42,28.58 IC3.8
C7  (via drill 0.5)
  Top 0.254: IC1.10 IC1.P$10 | IC3.9 62.77,28.57 62.54,28.79 61.69,28.79 v61.04,29.45
  Bottom 0.254: v61.04,29.45 60.88,29.61 60.88,44.71 55.29,50.29 52.54,50.29 52.04,50.79 52.04,52.06 IC1.10
CACK  (via drill 0.5)
  Top 0.254: IC1.14 IC1.P$14 | IC101.16 50.35,29.48 v49.79,30.04
  Bottom 0.254: v49.79,30.04 49.79,30.11 50.72,31.04 50.72,46.62 49.79,47.54 42.04,47.54 41.79,47.8 IC1.14
CKEYB_RX
  Top 0.305: R2.1 59.85,63.58 RN1.1 57.56,63.11 57.31,62.87 57.31,61.59 56.95,61.24 IC5.3
CKEYB_TX  (via drill 0.5)
  Top 0.305: RN1.3 v58.9,61.51 v58.9,61.52 | v51.59,62.47 51.52,62.54 IC5.16
  Bottom 0.305: v58.9,61.52 52.55,61.52 v51.59,62.47
CKEYB_TX_ORIG
  Top 0.305: R1.1 59.85,60.64 | 59.85,60.64 59.85,60.71 RN1.4 60.25,60.64 59.85,60.64 | IC5.2 59.8,60.59 59.85,60.64
D0
  Top 0.254: IC3.18 66.67,18.92 64.53,16.78 RN101.5
D1
  Top 0.254: IC3.17 66.02,19.02 63.73,16.73 RN101.6 63.74,16.63
D2
  Top 0.254: IC3.16 65.37,19.12 64.46,18.21 62.29,18.21 62.13,18.05 RN101.8
D3
  Top 0.254: IC3.15 64.72,19.22 64.13,18.71 57.71,18.71 57.46,18.46 RN102.5
D4
  Top 0.254: IC3.14 64.04,21.33 64.04,19.54 63.71,19.21 56.21,19.21 55.86,18.86 RN102.7
D5
  Top 0.254: IC3.13 63.42,19.92 63.21,19.71 55.71,19.71 55.06,19.06 RN102.8
D6
  Top 0.254: IC3.12 62.77,20.38 62.63,20.24 55.49,20.24 53.29,18.04 49.54,18.04 49.28,17.78 RN103.6
D7
  Top 0.254: IC3.11 62.04,21.28 62.04,20.79 61.97,20.72 55.22,20.72 53.07,18.57 49.07,18.57 48.48,17.98 RN103.7
DATA_DIR
  Top 0.254: IC1.34 IC1.P$34 59.54,33.23 59.54,26.54 60.54,25.54 67.79,25.54 67.97,25.72 IC3.1
GND  (via drill 0.5, 0.5 pad 1.02)
  Top 0.254: IC1.18 IC1.P$18 | IC1.13 IC1.P$13 | IC1.8 IC1.P$8 | IC1.3 IC1.P$3 | IC101.8 52.29,20.29 52.54,20.04 53.04,20.04 | 53.04,20.04 53.54,20.04 53.6,20.1 IC101.10 | IC101.9 52.95,20.13 53.04,20.04 | IC3.19 67.32,23.77 67.29,23.79 | 48.42,25.64 48.4,25.65 IC101.19 48.4,28.18 48.04,28.54 | U$1.P$17 48.78,3.62 J101.17 | U$1.P$15 J101.15 | U$1.P$13 59.8,3.61 J101.13 59.8,13.03 59.79,13.04 59.79,14.03 R104.1 | U$1.P$11 65.34,3.59 J101.11
  Top 0.305: IC5.10 56.59,65.79 56.59,65.14 | 56.59,65.14 56.59,64.49 | 56.59,64.49 56.59,63.84 | 56.59,63.84 56.59,63.19 | 56.59,63.19 56.59,62.55 IC5.5 | IC5.6 56.59,63.19 | IC5.7 56.59,63.84 | IC5.8 56.59,64.49 | IC5.9 56.59,65.14 | J1.4 63.66,66.67 | IC5.19 47.73,60.59 47.47,60.32 | 53.5,58.32 C1.1
  Bottom 0.254: 48.74,10 48.74,12.46 | 54.31,10.06 54.31,12.52 | 59.79,10.14 59.79,12.6 | 65.35,10.14 65.35,12.6
  other vias: 57.31,65.89 55.72,58.42 47.26,65.7 68.02,68.67 23.65,51.92 30.88,56.58 51.6,57.04 47.79,57.52 47.44,60 60.9,27.42 60.9,23.67 70.15,26.92 53.65,23.17 44.65,27.42 41.65,27.42 44.47,18.39 26.13,66.83 35.9,24.92 39.4,16.17 66.9,16.67 69.9,3.67 38.65,3.67 20.65,51.92 9.65,56.17 18.15,60.67 18.15,68.17 45.15,66.92 69.77,54.42 59.27,48.67 54.02,48.67 46.77,48.67 43.27,48.67 38.77,48.67 31.77,48.67 26.52,48.67 57.52,28.93 73.02,28.43 59.83,12.91
  pour Top (isolate 0.406): 0.04,70.29 76.79,70.29 76.79,0.04 31.79,0.04 31.79,30.29 19.54,30.29 19.54,53.04 0.04,53.04
  pour Bottom (isolate 0.406): 0.04,70.29 76.79,70.29 76.54,0.29 31.54,0.29 31.79,30.29 19.54,30.29 19.54,53.04 0.04,53.04
IN_OE_CS
  Top 0.254: IC1.P$15 IC1.15 39.29,52.11 39.29,50.29 39.79,49.79 44.04,49.79 45.64,48.2 45.64,30.7 46.04,30.29 47.29,30.29 49.05,28.53 IC101.18
  Top 0.305: IC1.P$15 39.25,56.02 R6.2
KEYB_RX  (via drill 0.5)
  Top 0.305: IC1.20 IC1.P$20 26.55,55.96 v26.51,56.36 | IC5.17 47.49,61.89 45.34,64.04 v44.54,64.04
  Bottom 0.305: v44.54,64.04 40.54,64.04 35.04,58.54 28.29,58.54 26.51,56.76 v26.51,56.36
KEYB_TX  (via drill 0.5)
  Top 0.254: IC1.P$29 IC1.29
  Top 0.305: IC5.4 53.2,61.89 52.86,62.23 52.86,64.77 v51.91,64.77 | v46.99,46.51 46.87,46.39 IC1.29
  Bottom 0.305: v51.91,64.77 48.02,64.77 43.79,60.54 43.79,56.54 40.56,53.31 40.56,47.03 41.04,46.54 46.96,46.54 v46.99,46.51
KEYB_TX_ORIG  (via drill 0.5)
  Top 0.254: IC1.P$32 IC1.32
  Top 0.305: v46.51,61.28 49.57,61.28 IC5.18
  Bottom 0.305: v46.51,61.28 46.53,61.29 47.54,61.29 50.64,58.2 50.64,56.2 50.64,47.95 54.49,44.1 IC1.32
N$1
  Top 0.305: J2.B5 5.04,63.38 4.92,63.26 4.92,55.27 4.54,54.89 R4.1
N$2
  Top 0.305: R3.1 4.29,57.71 4.29,63.79 4.88,64.38 J2.A5
N$3
  Top 0.305: IC6.2 42.65,63.93 43.04,63.54 43.04,61.42 R150.1
N$4
  Top 0.305: IC6.1 41.05,63.28 41.31,63.03 R151.1
N$7
  Top 0.305: LED2.3 36.06,68.28 35.79,68.03 35.79,65.04 36.29,64.54 37.85,64.54 IC6.4
N$21
  Top 0.305: RN1.6 64.53,61.51 J1.2
N$26
  Top 0.254: IC1.P$39 IC1.39
  Top 0.305: 72.06,57.47 72.37,57.47 | 73.54,56.29 73.54,50.54
  Top 0.61: 72.06,57.47 D1.C | IC1.39 72.27,36.54 70.04,38.77 70.04,47.04 73.54,50.54 | 72.37,57.47 73.54,56.29
OC_DRQ
  Top 0.254: RN104.6 43.41,18.18 D102.2
OC_INT
  Top 0.254: RN104.7 42.61,16.98 42.29,17.29 41.29,17.29 40.96,17.63 D101.2
ODRQ  (via drill 0.5)
  Top 0.254: D102.1 43.34,21.51 v43.42,21.59 | v52.04,24.04 52.3,24.3 IC101.13
  Bottom 0.254: v43.42,21.59 45.87,24.04 v52.04,24.04
OINT  (via drill 0.5)
  Top 0.254: D101.1 40.96,21.46 v41.04,21.54 | v50.54,24.87 51.29,24.87 51.65,25.23 IC101.14
  Bottom 0.254: v41.04,21.54 44.37,24.87 v50.54,24.87
OUT_LE1_DRQ  (via drill 0.5)
  Top 0.254: IC1.P$17 IC1.17 34.17,47.17 32.94,45.94 32.94,28.4 v33.04,28.29 | IC101.7 51.65,22.93 51.04,23.54 41.54,23.54 36.79,28.29 v36.54,28.29
  Top 0.305: IC1.P$17 34.17,56.1 R8.2
  Bottom 0.254: v36.54,28.29 v33.04,28.29
OUT_LE2_RESET  (via drill 0.5)
  Top 0.254: IC1.19 28.99,52.39 29.05,52.39 29.05,53.37 IC1.P$19 | IC101.15 51,30.33 50.72,30.62 50.72,44.62 v49.79,45.54
  Top 0.305: 29.05,53.3 IC1.P$19
  Bottom 0.254: v49.79,45.54 29.79,45.54 29.09,46.25 IC1.19
OUT_OE_INT
  Top 0.254: IC1.16 IC1.P$16 | IC101.6 51,22.83 50.79,23.04 40.54,23.04 35.48,28.11 35.48,45.93 36.71,47.16
  Top 0.305: 36.71,47.16 IC1.16 | IC1.P$16 36.71,56.02 R7.2
RST_C/D_REQ  (via drill 0.5)
  Top 0.254: IC1.P$12 IC1.12
  Top 0.305: IC1.P$12 46.87,54.57 46.55,54.57 46.28,54.85 46.28,55.48 45.32,56.44 v45.01,56.44 | v45.04,59.54 44.87,59.72 R150.2
  Bottom 0.305: v45.01,56.44 45.04,56.47 v45.04,59.54
SEL_I/O_DP_A1
  Top 0.254: IC1.P$11 IC1.11 49.41,49.66 48.18,48.43 48.18,30.32 49.7,28.8 IC101.17
  Top 0.305: 49.45,53.3 IC1.P$11 49.37,53.3
VBUS
  Top 0.254: IC1.P$40 IC1.40
VCC  (via drill 0.5)
  Top 0.254: R102.1 46.15,14.24 v45.32,13.41 | v51.51,14.21 51.55,14.24 R103.1 | 45.65,21.9 C5.1 45.65,22.54 | IC101.1 47.75,21.83 47.04,22.54 45.65,22.54 | 45.65,22.54 40.24,22.54 40.04,22.42 v40.04,22.29 | v46.54,26.04 47.29,26.04 47.79,26.54 47.79,27.13 IC101.20 | C3.1 69.19,23.44 | 69.19,23.44 68.04,22.29 68.04,21.43 IC3.20 | v69.21,23.49 69.29,23.46 69.19,23.44 | R125.1 55.09,29.5 55.54,29.04 v55.54,26.04
  Top 0.305: IC5.1 IC5.20 49.69,59.86 49.69,58.74 50.01,58.42 C1.2 | R6.1 R7.1 R8.1 25.6,57.76 25.37,57.99 | 25.37,57.99 C6.1 | 25.37,57.99 22.04,54.67 22.04,39.04 22.29,38.79 v30.29,38.79
  Top 0.406: IC2.5 20.99,63.59 22.04,62.54 23.04,62.54 23.29,62.29 23.29,61.29 | 23.29,61.29 C4.1 C101.1 | 23.51,61.51 23.29,61.29 | C6.1 25.38,59.36 C101.1 | v57.54,58.54 57.54,58.79 56.4,59.94 IC5.1 | C101.1 25.38,61.88 25.79,62.29 34.79,62.29 35.04,62.54 35.04,68.04 34.95,68.21 34.95,68.08 v34.92,68.42
  Bottom 0.254: v45.32,13.41 45.57,13.66 | 45.57,13.66 46.12,14.21 v51.51,14.21 | 45.57,13.66 45.57,19.02 44.54,20.04 41.04,20.04 40.04,21.04 v40.04,22.29 43.29,25.54 46.04,25.54 v46.54,26.04 v55.54,26.04 68.46,26.04 69.21,25.29 v69.21,23.49
  Bottom 0.305: v30.29,38.79 42.79,38.79 43.1,38.49 43.1,25.74 43.29,25.54
  Bottom 0.406: v57.54,58.54 58.79,58.54 60.04,59.79 60.04,66.29 57.29,69.04 35.17,69.04 v34.92,68.42
ZKEYB_RX
  Top 0.305: RN1.8 62.95,63.11 63.98,64.14 J1.3
ZKEYB_TX_ORIG
  Top 0.305: RN1.5 63.58,59.06 J1.1

### Text on the board
tNames: Cosmo2ex ACSI 4.05 | GND | RX | IKBD | TX | TX_ORIG
bNames: GND | RX | TX | IKBD | TX_ORIG